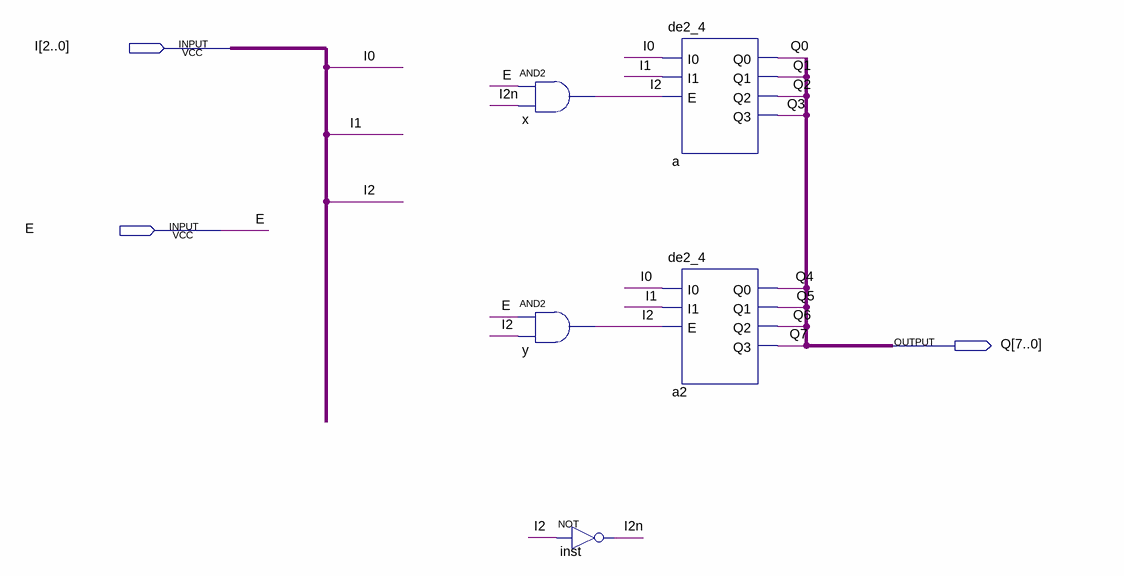
[diagram p0: schematic sheet]
// Quartus schematic de3_8.bdf as structural Verilog: 5 symbols, 3 pins
module de3_8 (
  input  [2:0] I,
  input  E,
  output [7:0] Q
);

  wire I2n;

  and x (I[2], E, I2n);
  and y (I[2], E, I[2]);
  not inst (I2n, I[2]);
  de2_4 a (.I0(I[0]), .I1(I[1]), .E(I[2]), .Q0(Q[0]), .Q1(Q[1]), .Q2(Q[2]), .Q3(Q[3]));
  de2_4 a2 (.I0(I[0]), .I1(I[1]), .E(I[2]), .Q0(Q[4]), .Q1(Q[5]), .Q2(Q[6]), .Q3(Q[7]));
endmodule
